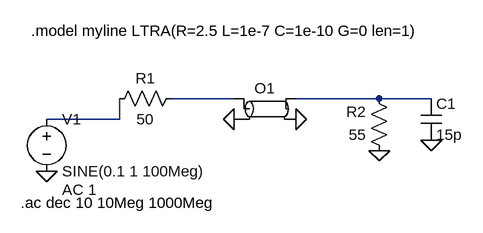
[diagram p0: schematic test_ltspice_tline_O.asc]
test_ltspice_tline_O.asc, the LTspice schematic file:
Version 4.1
SHEET 1 880 680
WIRE 352 128 256 128
WIRE 576 128 448 128
WIRE 656 128 576 128
WIRE 176 160 176 128
WIRE 176 160 64 160
FLAG 64 240 0
FLAG 352 160 0
FLAG 448 160 0
FLAG 576 208 0
FLAG 656 192 0
SYMBOL voltage 64 144 R0
WINDOW 123 24 124 Left 2
WINDOW 39 0 0 Left 0
SYMATTR Value2 AC 1
SYMATTR InstName V1
SYMATTR Value SINE(0.1 1 100Meg)
SYMBOL res 272 112 R90
WINDOW 0 0 56 VBottom 2
WINDOW 3 32 56 VTop 2
SYMATTR InstName R1
SYMATTR Value 50
SYMBOL res 592 224 R180
WINDOW 0 36 76 Left 2
WINDOW 3 36 40 Left 2
SYMATTR InstName R2
SYMATTR Value 55
SYMBOL cap 640 128 R0
SYMATTR InstName C1
SYMATTR Value 15p
SYMBOL ltline 400 144 R0
SYMATTR InstName O1
SYMATTR SpiceModel myline
SYMATTR Value ""
TEXT 40 24 Left 2 !.model myline LTRA(R=2.5 L=1e-7 C=1e-10 G=0 len=1)
TEXT 24 288 Left 2 !.ac dec 10 10Meg 1000Meg

The netlist it stands for:
* test_ltspice_tline_O.asc
V1 N003 0 SINE(0.1 1 100Meg) AC 1
R1 N001 N003 50
R2 0 N002 55
C1 N002 0 15p
O1 N001 0 N002 0 myline
.model myline LTRA(R=2.5 L=1e-7 C=1e-10 G=0 len=1)
.ac dec 10 10Meg 1000Meg
.backanno
.end